# Altium schematic sheet Controller_Processing.SchDoc
size Letter; Organization: Cegep Limoilou; Address1: 1300, 8e Avenue; Address2: Québec, QC; Address3: Canada; Address4: G1J 5L5; Revision: A; SheetNumber: 1; SheetTotal: 2; Conception: Xavier Champoux; Titre: Télécommande KJ turret; Modification: Xavier Champoux
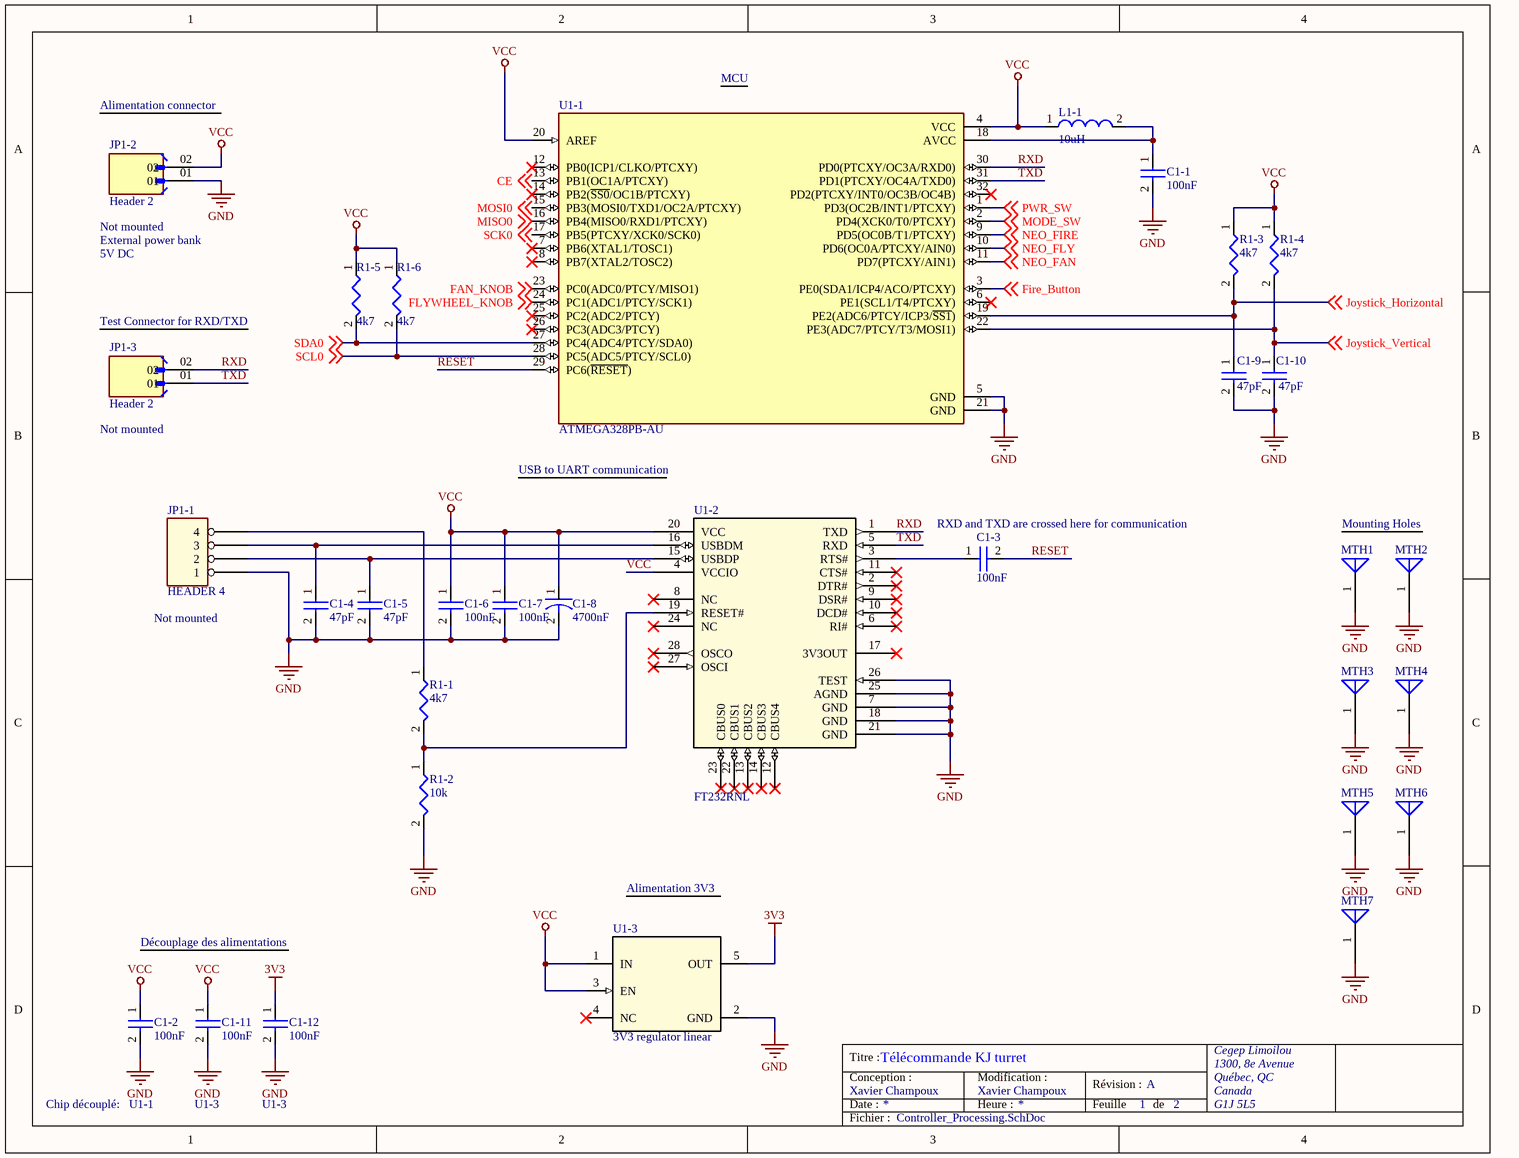
[diagram p0: Controller_Processing.SchDoc]

## Parts
C1-1  100nF  [0805_SMD]
C1-2  100nF  [0805_SMD]
C1-3  100nF  [0805_SMD]
C1-4  47pF  [0805_SMD]
C1-5  47pF  [0805_SMD]
C1-6  100nF  [0805_SMD]
C1-7  100nF  [0805_SMD]
C1-8  4700nF  [0805_SMD]
C1-9  47pF  [0805_SMD]
C1-10  47pF  [0805_SMD]
C1-11  100nF  [0805_SMD]
C1-12  100nF  [0805_SMD]
JP1-1  HEADER 4  [Header 4]
JP1-2  Header 2  [Header 2]
JP1-3  Header 2  [Header 2]
L1-1  10uH  [0805_SMD]
MTH1  ANTENNA  [MountingHole]  (value not drawn)
MTH2  ANTENNA  [MountingHole]  (value not drawn)
MTH3  ANTENNA  [MountingHole]  (value not drawn)
MTH4  ANTENNA  [MountingHole]  (value not drawn)
MTH5  ANTENNA  [MountingHole]  (value not drawn)
MTH6  ANTENNA  [MountingHole]  (value not drawn)
MTH7  ANTENNA  [MountingHole]  (value not drawn)
R1-1  4k7  [0805_SMD]
R1-2  10k  [0805_SMD]
R1-3  4k7  [0805_SMD]
R1-4  4k7  [0805_SMD]
R1-5  4k7  [0805_SMD]
R1-6  4k7  [0805_SMD]
U1-1  ATMEGA328PB-AU  [QFP80P900X900X120-32N]
U1-2  FT232RNL  [SSOP-28_FTD]
U1-3  3V3 regulator linear  [DBV0005A-IPC_A]

## Nets
3V3: C1-12.1 U1-3.5(OUT)
GND: C1-1.2 C1-2.2 C1-4.2 C1-5.2 C1-6.2 C1-7.2 C1-8.2 C1-9.2 C1-10.2 C1-11.2 C1-12.2 JP1-1.1 JP1-2.01 MTH1.1 MTH2.1 MTH3.1 MTH4.1 MTH5.1 MTH6.1 MTH7.1 R1-2.2 U1-1.5(GND) U1-1.21(GND) U1-2.7(GND) U1-2.18(GND) U1-2.21(GND) U1-2.25(AGND) U1-2.26(TEST) U1-3.2(GND)
VCC: C1-2.1 C1-6.1 C1-7.1 C1-8.1 C1-11.1 JP1-2.02 L1-1.1 R1-3.1 R1-4.1 R1-5.1 R1-6.1 U1-1.4(VCC) U1-1.20(AREF) U1-2.4(VCCIO) U1-2.20(VCC) U1-3.1(IN) U1-3.3(EN)
CE: U1-1.13(PB1(OC1A/PTCXY)) ; off-sheet CE
FAN_KNOB: U1-1.23(PC0(ADC0/PTCY/MISO1)) ; off-sheet FAN_KNOB
Fire_Button: U1-1.3(PE0(SDA1/ICP4/ACO/PTCXY)) ; off-sheet Fire_Button
FLYWHEEL_KNOB: U1-1.24(PC1(ADC1/PTCY/SCK1)) ; off-sheet FLYWHEEL_KNOB
Joystick_Horizontal: C1-9.1 R1-3.2 U1-1.19(PE2(ADC6/PTCY/ICP3/~{SS1})) ; off-sheet Joystick_Horizontal
Joystick_Vertical: C1-10.1 R1-4.2 U1-1.22(PE3(ADC7/PTCY/T3/MOSI1)) ; off-sheet Joystick_Vertical
MISO0: U1-1.16(PB4(MISO0/RXD1/PTCXY)) ; off-sheet MISO0
MODE_SW: U1-1.2(PD4(XCK0/T0/PTCXY)) ; off-sheet MODE_SW
MOSI0: U1-1.15(PB3(MOSI0/TXD1/OC2A/PTCXY)) ; off-sheet MOSI0
NEO_FAN: U1-1.11(PD7(PTCXY/AIN1)) ; off-sheet NEO_FAN
NEO_FIRE: U1-1.9(PD5(OC0B/T1/PTCXY)) ; off-sheet NEO_FIRE
NEO_FLY: U1-1.10(PD6(OC0A/PTCXY/AIN0)) ; off-sheet NEO_FLY
PWR_SW: U1-1.1(PD3(OC2B/INT1/PTCXY)) ; off-sheet PWR_SW
RESET: C1-3.2 U1-1.29(PC6(~{RESET}))
RXD: JP1-3.02 U1-1.30(PD0(PTCXY/OC3A/RXD0)) U1-2.1(TXD)
SCK0: U1-1.17(PB5(PTCXY/XCK0/SCK0)) ; off-sheet SCK0
SCL0: R1-6.2 U1-1.28(PC5(ADC5/PTCY/SCL0)) ; off-sheet SCL0
SDA0: R1-5.2 U1-1.27(PC4(ADC4/PTCY/SDA0)) ; off-sheet SDA0
TXD: JP1-3.01 U1-1.31(PD1(PTCXY/OC4A/TXD0)) U1-2.5(RXD)
NetC1-1_1: C1-1.1 L1-1.2 U1-1.18(AVCC)
NetC1-3_1: C1-3.1 U1-2.3(RTS#)
NetC1-4_1: C1-4.1 JP1-1.3 U1-2.16(USBDM)
NetC1-5_1: C1-5.1 JP1-1.2 U1-2.15(USBDP)
NetJP1-1_4: JP1-1.4 R1-1.1
NetR1-1_2: R1-1.2 R1-2.1 U1-2.19(RESET#)

Not connected (* = marked no-connect by the designer): U1-1 6(PE1(SCL1/T4/PTCXY))* 7(PB6(XTAL1/TOSC1))* 8(PB7(XTAL2/TOSC2))* 12(PB0(ICP1/CLKO/PTCXY))* 14(PB2(~{SS0}/OC1B/PTCXY))* 25(PC2(ADC2/PTCY))* 26(PC3(ADC3/PTCY))* 32(PD2(PTCXY/INT0/OC3B/OC4B))*; U1-2 2(DTR#)* 6(RI#)* 8(NC)* 9(DSR#)* 10(DCD#)* 11(CTS#)* 12(CBUS4)* 13(CBUS2)* 14(CBUS3)* 17(3V3OUT)* 22(CBUS1)* 23(CBUS0)* 24(NC)* 27(OSCI)* 28(OSCO)*; U1-3 4(NC)*

## Notes on the sheet
- (near U1-1) MCU
- Alimentation connector
- (near JP1-2) Not mounted
- External power bank
- 5V DC
- (near JP1-3) Test Connector for RXD/TXD
- (near JP1-3) Not mounted
- USB to UART communication
- (near C1-3) RXD and TXD are crossed here for communication
- Mounting Holes
- (near JP1-1) Not mounted
- Alimentation 3V3
- Découplage des alimentations
- Chip découplé:   U1-1
- U1-3
- Titre :
- Conception :
- Date :
- Modification :
- Heure :
- Révision :
- Feuille
- de
- Fichier :

## Library data of the parts
C1-1-C1-7 C1-9-C1-12 = CAP NP
C1-8 = CAP
JP1-2 JP1-3 = Header 2: MP: GRPB021VWVN-RC; Package: None; Availability: Unavailable; Price: None; Value: *
L1-1 = INDUCTOR
R1-1-R1-6 = R
U1-1 = ATMEGA328PB-AU: MF: Microchip; SnapEDA_Link: https://www.snapeda.com/parts/ATMEGA328PB-AU/Microchip/view-part/?ref=snap; Package: TQFP-32 Microchip; Value: *; MP: ATMEGA328PB-AU; Check_prices: https://www.snapeda.com/parts/ATMEGA328PB-AU/Microchip/view-part/?ref=eda
U1-2 = FT232RNL: Mfr_Name: FTDI, Future Technology Devices International Ltd; RefDes: RefDes; Type: Type
U1-3 = 3V3 regulator linear: No Description Available; Mfr_Name: Texas Instruments; TYPE: TYPE; RefDes: RefDes